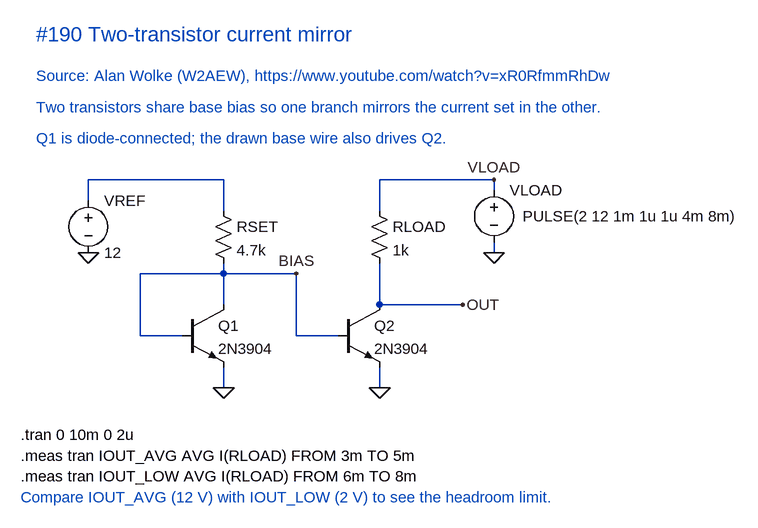
[diagram p0: schematic Two-transistor current mirror.asc]
Two-transistor current mirror.asc, the LTspice schematic file:
Version 4.1
SHEET 1 1532 690
WIRE 400 -304 192 -304
WIRE 816 -304 640 -304
WIRE 816 -288 816 -304
WIRE 192 -272 192 -304
WIRE 400 -256 400 -304
WIRE 640 -256 640 -304
WIRE 816 -192 816 -208
WIRE 400 -160 400 -176
WIRE 400 -160 272 -160
WIRE 512 -160 400 -160
WIRE 400 -112 400 -160
WIRE 640 -112 640 -176
WIRE 768 -112 640 -112
WIRE 272 -64 272 -160
WIRE 336 -64 272 -64
WIRE 512 -64 512 -160
WIRE 576 -64 512 -64
WIRE 400 16 400 -16
WIRE 640 16 640 -16
FLAG 512 -160 BIAS
FLAG 400 16 0
FLAG 640 16 0
FLAG 768 -112 OUT
FLAG 192 -192 0
FLAG 816 -192 0
FLAG 816 -304 VLOAD
SYMBOL voltage 192 -288 R0
SYMATTR InstName VREF
SYMATTR Value 12
SYMBOL voltage 816 -304 R0
WINDOW 3 44 56 Left 2
SYMATTR Value PULSE(2 12 1m 1u 1u 4m 8m)
SYMATTR InstName VLOAD
SYMBOL res 384 -272 R0
SYMATTR InstName RSET
SYMATTR Value 4.7k
SYMBOL res 624 -272 R0
SYMATTR InstName RLOAD
SYMATTR Value 1k
SYMBOL npn 336 -112 R0
SYMATTR InstName Q1
SYMATTR Value 2N3904
SYMBOL npn 576 -112 R0
SYMATTR InstName Q2
SYMATTR Value 2N3904
TEXT 88 88 Left 2 !.tran 0 10m 0 2u
TEXT 88 120 Left 2 !.meas tran IOUT_AVG AVG I(RLOAD) FROM 3m TO 5m
TEXT 88 152 Left 2 !.meas tran IOUT_LOW AVG I(RLOAD) FROM 6m TO 8m
TEXT 88 184 Left 2 ;Compare IOUT_AVG (12 V) with IOUT_LOW (2 V) to see the headroom limit.
TEXT 112 -368 Left 2 ;Q1 is diode-connected; the drawn base wire also drives Q2.
TEXT 112 -528 Left 3 ;#190 Two-transistor current mirror
TEXT 112 -464 Left 2 ;Source: Alan Wolke (W2AEW), https://www.youtube.com/watch?v=xR0RfmmRhDw
TEXT 112 -416 Left 2 ;Two transistors share base bias so one branch mirrors the current set in the other.

The netlist it stands for:
* Two-transistor current mirror.asc
VREF N001 0 12
VLOAD VLOAD 0 PULSE(2 12 1m 1u 1u 4m 8m)
RSET N001 BIAS 4.7k
RLOAD VLOAD OUT 1k
Q1 BIAS BIAS 0 0 2N3904
Q2 OUT BIAS 0 0 2N3904
.model NPN NPN
.model PNP PNP
.lib standard.bjt
.tran 0 10m 0 2u
.meas tran IOUT_AVG AVG I(RLOAD) FROM 3m TO 5m
.meas tran IOUT_LOW AVG I(RLOAD) FROM 6m TO 8m
* Compare IOUT_AVG (12 V) with IOUT_LOW (2 V) to see the headroom limit.
* Q1 is diode-connected; the drawn base wire also drives Q2.
* #190 Two-transistor current mirror
* Source: Alan Wolke (W2AEW), https://www.youtube.com/watch?v=xR0RfmmRhDw
* Two transistors share base bias so one branch mirrors the current set in the other.
.backanno
.end